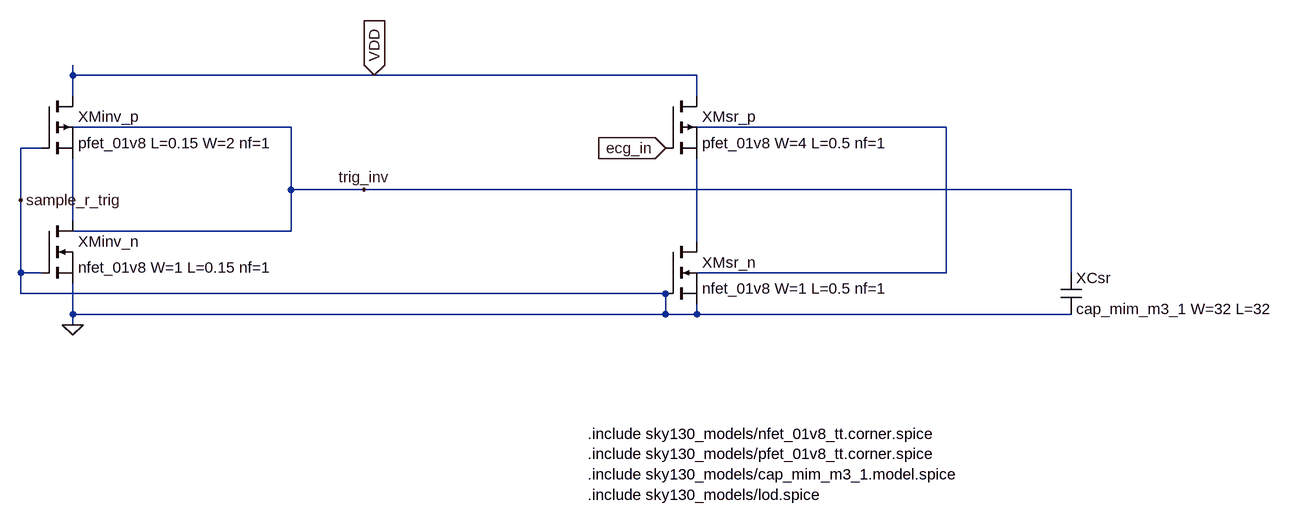
[diagram p0: schematic qrs_symmetry_schematic_F8.asc]
qrs_symmetry_schematic_F8.asc, the LTspice schematic file:
Version 4.1
SHEET 1 1000 680
WIRE -880 -336 -880 -352
WIRE -416 -336 -880 -336
WIRE 80 -336 -416 -336
WIRE -880 -304 -880 -336
WIRE 80 -304 80 -336
WIRE -544 -256 -880 -256
WIRE 464 -256 80 -256
WIRE -928 -224 -960 -224
WIRE -544 -160 -544 -256
WIRE -432 -160 -544 -160
WIRE 656 -160 -432 -160
WIRE -960 -144 -960 -224
WIRE -880 -112 -880 -208
WIRE -544 -96 -544 -160
WIRE -544 -96 -880 -96
WIRE 80 -80 80 -208
WIRE -960 -32 -960 -144
WIRE -928 -32 -960 -32
WIRE 464 -32 464 -256
WIRE 464 -32 80 -32
WIRE 656 -32 656 -160
WIRE -960 0 -960 -32
WIRE 32 0 -960 0
WIRE -880 32 -880 -16
WIRE 32 32 32 0
WIRE 32 32 -880 32
WIRE 80 32 80 16
WIRE 80 32 32 32
WIRE 656 32 80 32
WIRE -880 48 -880 32
FLAG -432 -160 trig_inv
FLAG -880 48 0
FLAG -960 -144 sample_r_trig
FLAG -416 -336 VDD
IOPIN -416 -336 In
FLAG 32 -224 ecg_in
IOPIN 32 -224 In
SYMBOL nmos -928 -112 R0
SYMATTR InstName XMinv_n
SYMATTR Value nfet_01v8 W=1 L=0.15 nf=1
SYMBOL pmos -928 -304 R0
SYMATTR InstName XMinv_p
SYMATTR Value pfet_01v8 L=0.15 W=2 nf=1
SYMBOL pmos 32 -304 R0
SYMATTR InstName XMsr_p
SYMATTR Value pfet_01v8 W=4 L=0.5 nf=1
SYMBOL nmos 32 -80 R0
SYMATTR InstName XMsr_n
SYMATTR Value nfet_01v8 W=1 L=0.5 nf=1
SYMBOL cap 640 -32 R0
SYMATTR InstName XCsr
SYMATTR Value cap_mim_m3_1 W=32 L=32
TEXT -88 216 Left 2 !.include sky130_models/nfet_01v8_tt.corner.spice\n.include sky130_models/pfet_01v8_tt.corner.spice\n.include sky130_models/cap_mim_m3_1.model.spice\n.include sky130_models/lod.spice

The netlist it stands for:
* qrs_symmetry_schematic_F8.asc
M§XMinv_n N002 0 0 0 nfet_01v8 W=1 L=0.15 nf=1
M§XMinv_p VDD 0 N002 N002 pfet_01v8 L=0.15 W=2 nf=1
M§XMsr_p VDD ecg_in N003 N003 pfet_01v8 W=4 L=0.5 nf=1
M§XMsr_n N003 0 0 0 nfet_01v8 W=1 L=0.5 nf=1
C§XCsr trig_inv 0 cap_mim_m3_1 W=32 L=32
.model NMOS NMOS
.model PMOS PMOS
.lib standard.mos
.include sky130_models/nfet_01v8_tt.corner.spice
.include sky130_models/pfet_01v8_tt.corner.spice
.include sky130_models/cap_mim_m3_1.model.spice
.include sky130_models/lod.spice
.backanno
.end